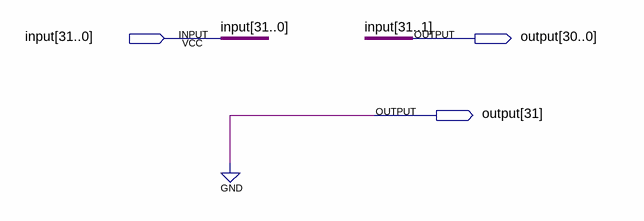
[diagram p0: schematic sheet]
// Quartus schematic SHR.bdf as structural Verilog: 0 symbols, 3 pins
module SHR (
  input  [31:0] \input ,
  output [31:0] \output 
);


  assign \output  = {1'b0, \input [31:1]};
endmodule
